# Altium schematic sheet USB.SchDoc
size 300 x 200 mm; SheetNumber: 5; SheetTotal: 12
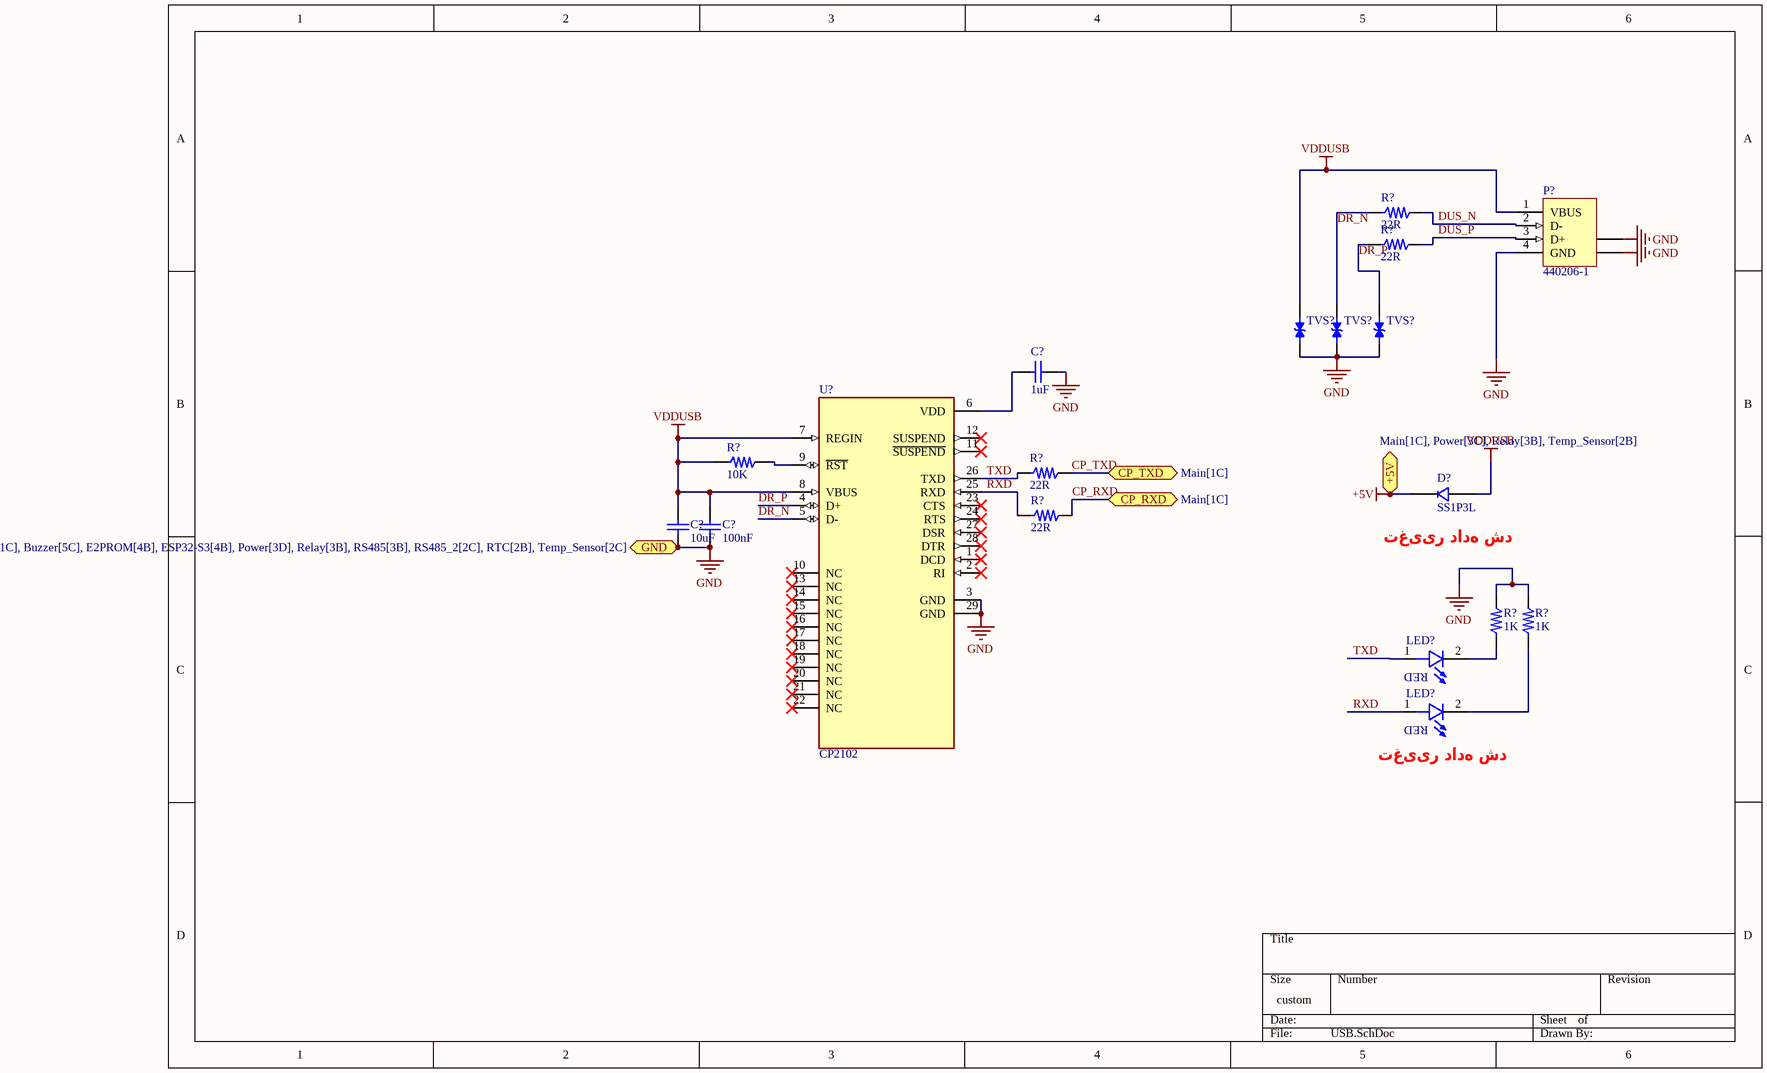
[diagram p0: USB.SchDoc]

## Parts
(Parts that share a designator on the sheet are numbered #1, #2 ... from top to bottom, then left to right.)
C?#1  1uF  [C0805]
C?#2  10uF  [C0805]
C?#3  100nF  [C0805]
D?  SS1P3L  [SS1P3L]
LED?#1  Red  [LED-0805-G]  (value not drawn)
LED?#2  Red  [LED-0805-G]  (value not drawn)
P?  440206-1  [USB]
R?#1  22R  [R0805]
R?#2  22R  [R0805]
R?#3  10K  [R0805]
R?#4  22R  [R0805]
R?#5  22R  [R0805]
R?#6  1K  [R0805]
R?#7  1K  [R0805]
TVS?#1  LESD5D5.0CT1G  [TVS]  (value not drawn)
TVS?#2  LESD5D5.0CT1G  [TVS]  (value not drawn)
TVS?#3  LESD5D5.0CT1G  [TVS]  (value not drawn)
U?  CP2102  [CP2102]

## Ports
+5V (bidir, see Main[1C], Power[3C], Relay[3B], Temp_Sensor[2B]), CP_RXD (bidir, see Main[1C]), CP_TXD (bidir, see Main[1C]), GND (bidir, see Main[1C], Buzzer[5C], E2PROM[4B], ESP32-S3[4B], Power[3D], Relay[3B], RS485[3B], RS485_2[2C], RTC[2B], Temp_Sensor[2C])

## Nets
+5V: D?.1(Cathode) ; port +5V
GND: C?#1.1 C?#2.1 C?#3.1 P?.4(GND) P?.5(SHLD) P?.6(SHLD) R?#6.1 R?#7.1 TVS?#1.1 TVS?#2.1 TVS?#3.1 U?.3(GND) U?.29(GND) ; port GND
VDDUSB: C?#2.2 C?#3.2 D?.2(Anod) P?.1(VBUS) R?#3.2 TVS?#1.2 U?.7(REGIN) U?.8(VBUS)
CP_RXD: R?#5.1 ; port CP_RXD
CP_TXD: R?#4.1 ; port CP_TXD
DR_N: R?#1.2 TVS?#2.2 U?.5(D-)
DR_P: R?#2.2 TVS?#3.2 U?.4(D+)
DUS_N: P?.2(D-) R?#1.1
DUS_P: P?.3(D+) R?#2.1
RXD: LED?#2.1 R?#5.2 U?.25(RXD)
TXD: LED?#1.1 R?#4.2 U?.26(TXD)
NetC?#1_2: C?#1.2 U?.6(VDD)
NetLED?#1_2: LED?#1.2 R?#6.2
NetLED?#2_2: LED?#2.2 R?#7.2
NetR?#3_1: R?#3.1 U?.9(~{RST})

Not connected (* = marked no-connect by the designer): U? 1(DCD)* 2(RI)* 10(NC)* 11(~{SUSPEND})* 12(SUSPEND)* 13(NC)* 14(NC)* 15(NC)* 16(NC)* 17(NC)* 18(NC)* 19(NC)* 20(NC)* 21(NC)* 22(NC)* 23(CTS)* 24(RTS)* 27(DSR)* 28(DTR)*

## Notes on the sheet
- (near D?) تغییر داده شد
- (near LED?#2) تغییر داده شد
- (in symbol LED_0805) RED

## Library data of the parts
C?#1-C?#3 = 2-Cap: Bipolar Capacitor; Type: MKT
LED?#1 LED?#2 = LED_0805
P? = 440206-1: USB 1.1, Vertical, Thru-Hole, B Type, Receptacle, 4 Position, White; ContactMaterial: Copper Alloy; ContactPlating: Gold (30) over Nickel; TerminationLength: 2.84mm [0.112in.]; PCB_Layout: Complies with manufacturer's recommendation.; DrillSize: Corresponds to nominal value.; PanelGround: Without; Published: 15-Jul-2004; DatasheetDocument: 04-May-2001; PackageDocument: 04-May-2001; PackageReference: 440206; Publisher: Altium Limited; HousingMaterial: Thermoplastic; ComponentLink1Description: Manufacturer Link; ComponentLink1URL: http://www.tycoelectronics.com/; ComponentLink2Description: Packaging Specification; ComponentLink2URL: http://ecommas.tycoelectronics.com/commerce/DocumentDelivery/DDEController?Action=showdoc&DocId=Customer+Drawing%7F440206%7FA%7Ftif%7FEnglish%7FC_440206_A.tif
R?#1-R?#7 = myRes_1
  R?#1 R?#2 R?#4 R?#5: Value: 22R
  R?#3: Value: 10K
  R?#6 R?#7: Value: 1K
TVS?#1-TVS?#3 = TVS 5V